# Altium schematic sheet LoRa.SchDoc
size A; SheetNumber: 5; SheetTotal: 5
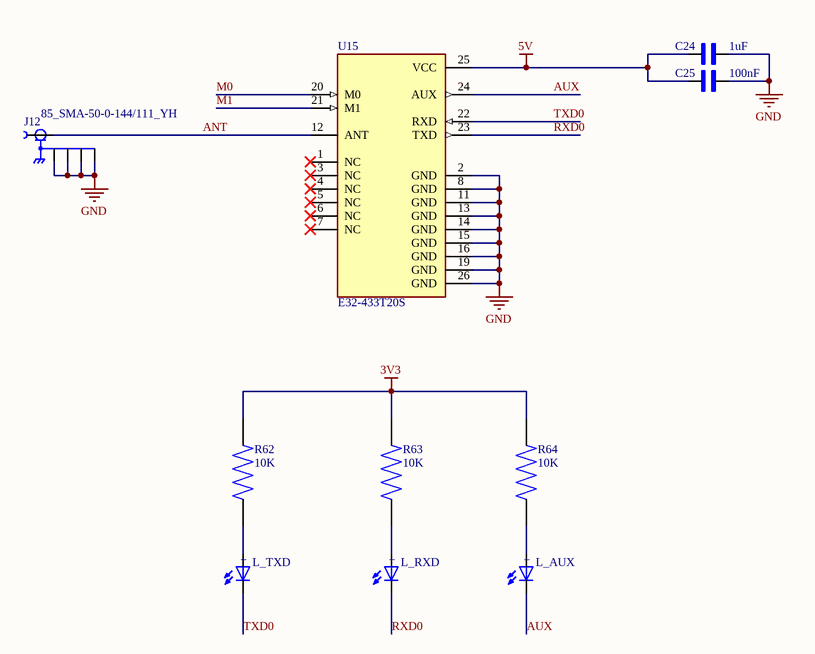
[diagram p0: LoRa.SchDoc]

## Parts
C24  1uF  [CAPC1608X94N]
C25  100nF  [CAPC1608X94N]
J12  85_SMA-50-0-144/111_YH  [HUBER+SUHNER_85_SMA-50-0-144/111_YH]
L_AUX  WL-SMCW_1206  [WL-SMCW_1206]  (value not drawn)
L_RXD  WL-SMCW_1206  [WL-SMCW_1206]  (value not drawn)
L_TXD  WL-SMCW_1206  [WL-SMCW_1206]  (value not drawn)
R62  10K  [RES_ERJU03J474V]
R63  10K  [RES_ERJU03J474V]
R64  10K  [RES_ERJU03J474V]
U15  E32-433T20S  [MODULE_E32-433T20S]

## Nets
3V3: R62.2 R63.2 R64.2
5V: C24.1 C25.1 U15.25(VCC)
GND: C24.2 C25.2 J12.G1 J12.G2 J12.G3 J12.G4 U15.2(GND) U15.8(GND) U15.11(GND) U15.13(GND) U15.14(GND) U15.15(GND) U15.16(GND) U15.19(GND) U15.26(GND)
ANT: J12.1 U15.12(ANT)
AUX: L_AUX.1(NEG) U15.24(AUX)
M0: U15.20(M0)
M1: U15.21(M1)
RXD0: L_RXD.1(NEG) U15.23(TXD)
TXD0: L_TXD.1(NEG) U15.22(RXD)
NetL_AUX_2: L_AUX.2(POS) R64.1
NetL_RXD_2: L_RXD.2(POS) R63.1
NetL_TXD_2: L_TXD.2(POS) R62.1

Not connected (* = marked no-connect by the designer): U15 1(NC)* 3(NC)* 4(NC)* 5(NC)* 6(NC)* 7(NC)*

## Notes on the sheet
- (in symbol WL-SMCW_1206) +

## Library data of the parts
C24 C25 = cap_0603_VJ0603D3R9DXCAP: cap 0603 (1608 Metric); MF: Vishay Vitramon; SnapEDA_Link: https://www.snapeda.com/parts/VJ0603D3R9DXCAP/Vishay/view-part/?ref=snap; Package: 1608 Vishay Vitramon; Value: *; MP: VJ0603D3R9DXCAP; Check_prices: https://www.snapeda.com/parts/VJ0603D3R9DXCAP/Vishay/view-part/?ref=eda
J12 = 85_SMA-50-0-144/111_YH: RF Connector, SMA Right angle PCB jack(f) | HUBER+SUHNER 85_SMA-50-0-144/111_YH; SnapEDA_Link: https://www.snapeda.com/parts/85_SMA-50-0-144/111_YH/Huber%252BSuhner/view-part/?ref=snap; Package: None; Value: *; MF: HUBER+SUHNER; MP: 85_SMA-50-0-144/111_YH; Check_prices: https://www.snapeda.com/parts/85_SMA-50-0-144/111_YH/Huber%252BSuhner/view-part/?ref=eda
L_AUX L_RXD L_TXD = WL-SMCW_1206: 1206, Blue Typ.(@20mA): 470nm, 145mcd, 3.2V, 140Â° InGaN; MF: Wurth Electronics; MP: 150120BS75000; SnapEDA_Link: https://www.snapeda.com/parts/150120BS75000/Wurth+Electronics/view-part/?ref=snap; Package: 1206 Wurth Electronics; Value: *; Check_prices: https://www.snapeda.com/parts/150120BS75000/Wurth+Electronics/view-part/?ref=eda
R62-R64 = res_0603_ERJU03J474V: 0603 Anti-Sulfurated; MF: Panasonic; SnapEDA_Link: https://www.snapeda.com/parts/ERJU03J474V/Panasonic/view-part/?ref=snap; Package: 1608-2 Panasonic; Value: *; MP: ERJU03J474V; Check_prices: https://www.snapeda.com/parts/ERJU03J474V/Panasonic/view-part/?ref=eda
U15 = E32-433T20S: Wireless serial port module (UART); MF: EBYTE; Check_prices: https://www.snapeda.com/parts/E32-433T20S/EBYTE/view-part/?ref=eda; Package: Package; MP: E32-433T20S; Value: *; SnapEDA_Link: https://www.snapeda.com/parts/E32-433T20S/EBYTE/view-part/?ref=snap; Price: None; Availability: Not in stock